# Altium project Karta Radiowa.PrjPcb (part 8 of 9)

## Sheet Zegar.SchDoc
size A3
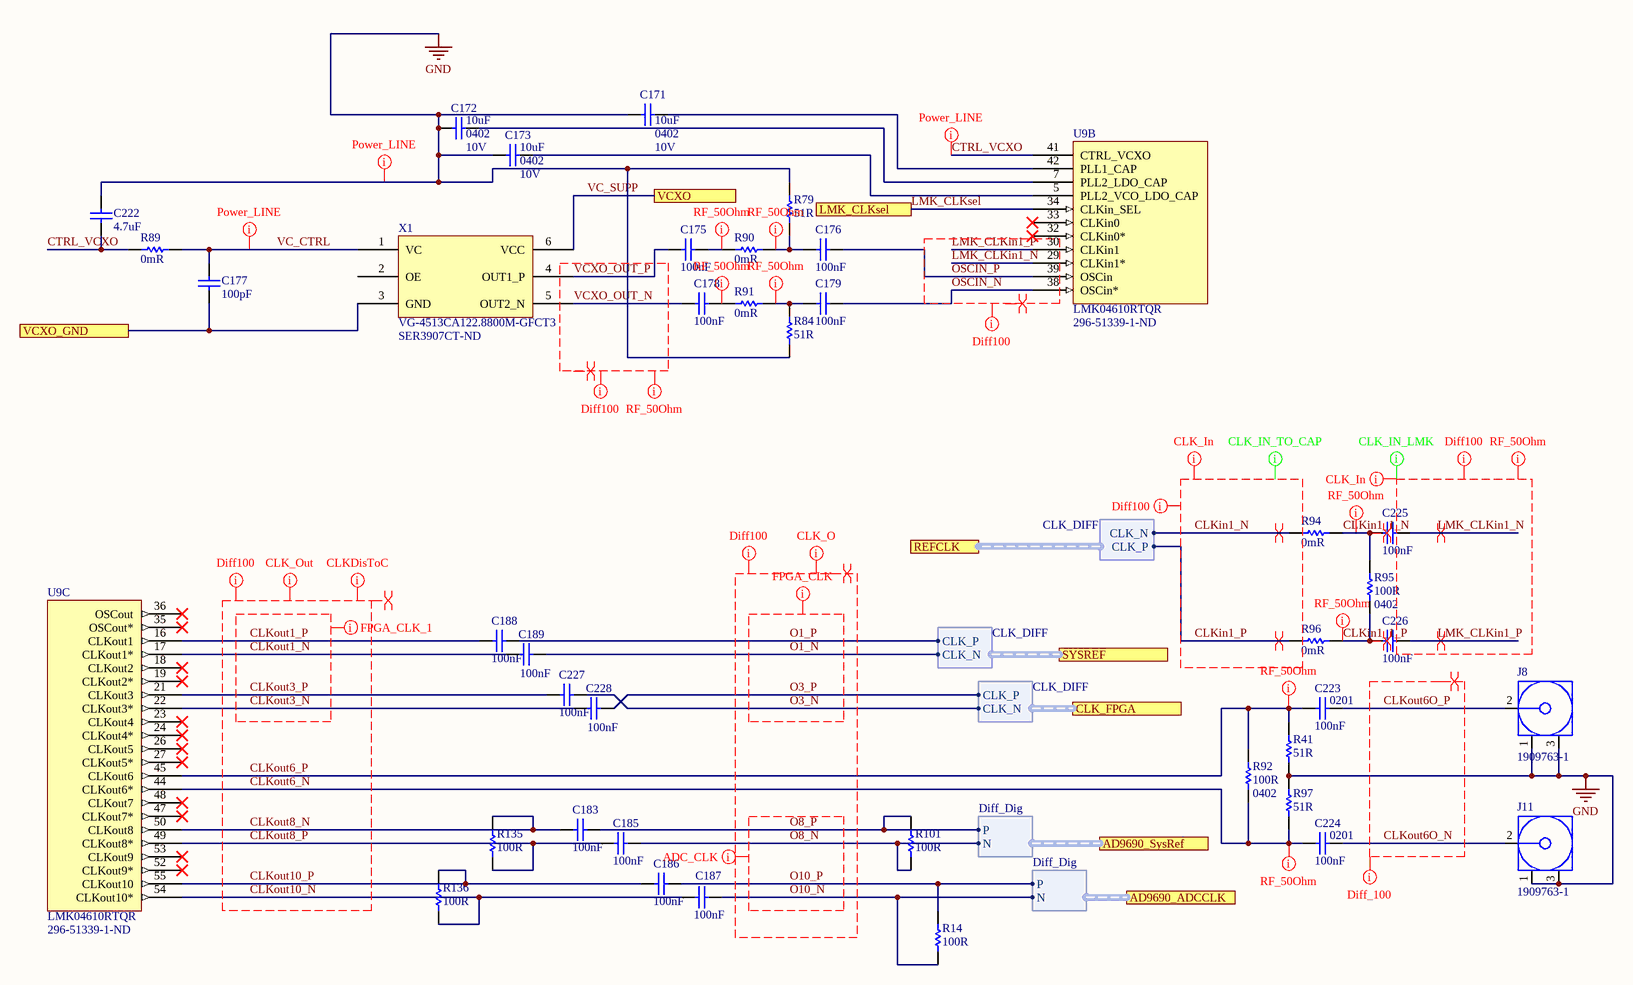
[diagram p11: Zegar.SchDoc]

### Parts
C171  10uF  Case/Package: 0402  Voltage Rating: 10V  [CAP 0402/1005 RF KK]
C172  10uF  Case/Package: 0402  Voltage Rating: 10V  [CAP 0402/1005 RF KK]
C173  10uF  Case/Package: 0402  Voltage Rating: 10V  [CAP 0402/1005 RF KK]
C175  100nF  [CAP 0201/0603 KK]
C176  100nF  [CAP 0201/0603 KK]
C177  100pF  [CAP 0402/1005 RF KK]
C178  100nF  [CAP 0201/0603 KK]
C179  100nF  [CAP 0201/0603 KK]
C183  100nF  [CAP 0201/0603 KK]
C185  100nF  [CAP 0201/0603 KK]
C186  100nF  [CAP 0201/0603 KK]
C187  100nF  [CAP 0201/0603 KK]
C188  100nF  [CAP 0201/0603 KK]
C189  100nF  [CAP 0201/0603 KK]
C222  4.7uF  [CAP 0603/1608 RF]
C223  100nF  Case Code (Imperial): 0201  [CAP 0201/0603 KK]
C224  100nF  Case Code (Imperial): 0201  [CAP 0201/0603 KK]
C225  100nF  [CAP 0201/0603 KK]
C226  100nF  [CAP 0201/0603 KK]
C227  100nF  [CAP 0201/0603 KK]
C228  100nF  [CAP 0201/0603 KK]
J8  1909763-1  [TECO-1909763-1_V]
J11  1909763-1  [TECO-1909763-1_V]
R14  100R  [RES 0201/0603]
R41  51R  [RES 0402/1005 RF KK]
R79  51R  [RES 0402/1005 RF KK]
R84  51R  [RES 0402/1005 RF KK]
R89  0mR  [RES 0402/1005 RF KK]
R90  0mR  [RES 0402/1005 RF KK]
R91  0mR  [RES 0402/1005 RF KK]
R92  100R  Case/Package: 0402  [RES 0402/1005 RF KK]
R94  0mR  [RES 0402/1005 RF KK]
R95  100R  Case/Package: 0402  [RES 0402/1005 RF KK]
R96  0mR  [RES 0402/1005 RF KK]
R97  51R  [RES 0402/1005 RF KK]
R101  100R  [RES 0201/0603]
R135  100R  [RES 0201/0603]
R136  100R  [RES 0201/0603]
U9  LMK04610RTQR  Supplier Part Number 1: 296-51339-1-ND  [LMK04610]  (parts B,C of 4)
X1  VG-4513CA122.8800M-GFCT3  Supplier Part Number 1: SER3907CT-ND  [VG-4513CA]

### Ports
AD9690_ADCCLK (harness Diff_Dig), AD9690_SysRef (harness Diff_Dig), CLK_FPGA (harness CLK_DIFF), LMK_CLKsel, REFCLK (harness CLK_DIFF), SYSREF (harness CLK_DIFF), VCXO, VCXO_GND

### Harnesses
Diff_Dig: P, N
CLK_DIFF: CLK_P, CLK_N

### Nets
GND: C171.2 C172.2 C173.2 C222.2 J8.1 J8.3 J11.1 J11.3 R41.1 R79.2 R84.1 R97.1
CLKin1_1_N: C225.1 R94.2 R95.1
CLKin1_1_P: C226.1 R95.2 R96.2
CLKin1_N: R94.1 ; port REFCLK.CLK_N
CLKin1_P: R96.1 ; port REFCLK.CLK_P
CLKout1_N: C189.1 U9.17(CLKout1*)
CLKout1_P: C188.1 U9.16(CLKout1)
CLKout3_N: C228.1 U9.22(CLKout3*)
CLKout3_P: C227.1 U9.21(CLKout3)
CLKout6_N: C224.1 R92.2 R97.2 U9.44(CLKout6*)
CLKout6_P: C223.1 R41.2 R92.1 U9.45(CLKout6)
CLKout6O_N: C224.2 J11.2
CLKout6O_P: C223.2 J8.2
CLKout8_N: C183.1 R135.2 U9.50(CLKout8)
CLKout8_P: C185.1 R135.1 U9.49(CLKout8*)
CLKout10_N: C187.1 R136.1 U9.54(CLKout10*)
CLKout10_P: C186.1 R136.2 U9.55(CLKout10)
CTRL_VCXO: C222.1 R89.1 U9.41(CTRL_VCXO)
GND_VCXO: C177.1 X1.3(GND) ; port VCXO_GND
LMK_CLKin1_N: C225.2 U9.29(CLKin1*)
LMK_CLKin1_P: C226.2 U9.30(CLKin1)
LMK_CLKsel: U9.34(CLKin_SEL) ; port LMK_CLKsel
O1_N: C189.2 ; port SYSREF.CLK_N
O1_P: C188.2 ; port SYSREF.CLK_P
O3_N: C227.2 ; port CLK_FPGA.CLK_N
O3_P: C228.2 ; port CLK_FPGA.CLK_P
O8_N: C185.2 R101.1 ; port AD9690_SysRef.N  [project net adc_Sysref_N]
O8_P: C183.2 R101.2 ; port AD9690_SysRef.P  [project net adc_Sysref_P]
O10_N: C187.2 R14.1 ; port AD9690_ADCCLK.N  [project net ADC_CLK9690_N]
O10_P: C186.2 R14.2 ; port AD9690_ADCCLK.P  [project net ADC_CLK9690_P]
OSCIN_N: C179.2 U9.38(OSCin*)
OSCIN_P: C176.2 U9.39(OSCin)
VC_CTRL: C177.2 R89.2 X1.1(VC)
VC_SUPP: X1.6(VCC) ; port VCXO
VCXO_OUT_N: C178.1 X1.5(OUT2_N)
VCXO_OUT_P: C175.1 X1.4(OUT1_P)
NetC171_1: C171.1 U9.42(PLL1_CAP)
NetC172_1: C172.1 U9.7(PLL2_LDO_CAP)
NetC173_1: C173.1 U9.5(PLL2_VCO_LDO_CAP)
NetC175_2: C175.2 R90.1
NetC176_1: C176.1 R79.1 R90.2
NetC178_2: C178.2 R91.1
NetC179_1: C179.1 R84.2 R91.2

Not connected (* = marked no-connect by the designer): U9 18(CLKout2)* 19(CLKout2*)* 23(CLKout4)* 24(CLKout4*)* 26(CLKout5)* 27(CLKout5*)* 32(CLKin0*)* 33(CLKin0)* 35(OSCout*)* 36(OSCout)* 47(CLKout7*)* 48(CLKout7)* 52(CLKout9*)* 53(CLKout9)*; X1 2(OE)

### Layout directives
net class CLK_IN1: CLKin1_N, CLKin1_P
net class CLK_IN2: LMK_CLKin1_N, LMK_CLKin1_P
net class CLK_O: O1_N, O1_P, O3_N, O3_P, O8_N, O8_P, O10_N, O10_P
net class ADC_CLK: O8_N, O8_P, O10_N, O10_P
net class Diff_100: CLKin1_N, CLKin1_P, CLKout1_N, CLKout1_P, CLKout3_N, CLKout3_P, CLKout6_N, CLKout6_P, CLKout6O_N, CLKout6O_P, CLKout8_N, CLKout8_P, CLKout10_N, CLKout10_P, LMK_CLKin1_N, LMK_CLKin1_P, O1_N, O1_P, O3_N, O3_P, O8_N, O8_P, O10_N, O10_P, OSCIN_N, OSCIN_P, VCXO_OUT_N, VCXO_OUT_P
net class CLK_Out: CLKout1_N, CLKout1_P, CLKout3_N, CLKout3_P, CLKout6_N, CLKout6_P, CLKout8_N, CLKout8_P, CLKout10_N, CLKout10_P
net class CLKDisToC: CLKout1_N, CLKout1_P, CLKout3_N, CLKout3_P, CLKout6_N, CLKout6_P, CLKout8_N, CLKout8_P, CLKout10_N, CLKout10_P
net class Power_LINE: CTRL_VCXO, GND, VC_CTRL
net class CLK_IN_TO_CAP: CLKin1_N, CLKin1_P
net class CLK_IN_LMK: LMK_CLKin1_N, LMK_CLKin1_P
differential pair; differential pair class Diff_100: CLKin1_1_N, CLKin1_1_P, CLKin1_N, CLKin1_P, CLKout1_N, CLKout1_P, CLKout3_N, CLKout3_P, CLKout6_N, CLKout6_P, CLKout6O_N, CLKout6O_P, CLKout8_N, CLKout8_P, CLKout10_N, CLKout10_P, LMK_CLKin1_N, LMK_CLKin1_P, O1_N, O1_P, O3_N, O3_P, O8_N, O8_P, O10_N, O10_P, OSCIN_N, OSCIN_P, VCXO_OUT_N, VCXO_OUT_P
net class FPGA_CLK: O1_N, O1_P, O3_N, O3_P
net class Single50: CLKin1_1_N, CLKin1_1_P, CLKout6_N, CLKout6_P, LMK_CLKin1_N, LMK_CLKin1_P, NetC175_2, NetC176_1, NetC178_2, NetC179_1, VCXO_OUT_N, VCXO_OUT_P
net class FPGA_CLK_1: CLKout1_N, CLKout1_P, CLKout3_N, CLKout3_P

### Notes on the sheet
- Title
- Size:
- Date:
- A3
- Number:
- Time:
- Revision:
- Sheet
- of
- File:

### Library data of the parts
C171-C173 = Capacitor: CAP CER 10UF 10V X5R 0402; Manufacturer: Samsung; Manufacturer Part Number: CL05A106MP8NUB8; Tolerance: 20%; Supplier 1: Digi-Key; Supplier Part Number 1: 1276-6830-1-ND; RoHS: Yes; Category: Ceramic Capacitors; Stock 1: 1457006; Pricing 1: 1=0,40000, 10=0,27900, 50=0,19500, 100=0,16710, 500=0,12534, 1000=0,10584, 2500=0,10027 (USD); Mount: Surface Mount; Case Code (Metric): 1005; Case Code (Imperial): 0402; Min Operating Temperature: -55°C; Max Operating Temperature: 85°C; Packaging: Tape and Reel; Capacitance: 10uF; Length: 0.039inch; Width: 0.02inch; Thickness: 0.035inch; ComponentLink1URL: http://www.samsungsem.com/kr/support/product-search/mlcc/CL05A106MP8NUB8.jsp?src-supplier=Digi-Key; ComponentLink1Description: http://www.samsungsem.com/kr/support/product-search/mlcc/CL05A106MP8NUB8.jsp?src-supplier=Digi-Key
C175 C176 C178 C179 C183 C185-C189 C223-C228 = Capacitor: Manufacturer 1: Yageo; Manufacturer Part Number 1: CC0201KRX5R6BB104; Voltage Rating (DC): 10V; Tolerance: 10%; Dielectric: X5R; Supplier 1: Digi-Key; Supplier Part Number 1: 311-1593-1-ND; Stock 1: 1229391; Pricing 1: 1=0.10000, 10=0.03800, 100=0.01690, 500=0.01208, 1000=0.00949, 2500=0.00862, 5000=0.00794 (USD); RoHS: Yes; Mount: Surface Mount; Case/Package: 0201; Weight: 6E-06oz; Case Code (Metric): 0603; Min Operating Temperature: -55°C; Max Operating Temperature: 85°C; Capacitance: 100nF; Packaging: Tape and Reel; Termination: SMD/SMT; Composition: Ceramic; Voltage Rating: 10V; Length: 0.6mm; Height: 0.3mm; Width: 0.012inch; Thickness: 0.013inch; Depth: 0.3mm; Radiation Hardening: No; Lead Free: Lead Free; Halogen Free: Halogen Free; ComponentLink1URL: https://datasheet.ciiva.com/17437/upy-gphc-x5r-4v-to-50v-12-17437495.pdf?src-supplier=Avnet+Europe; ComponentLink1Description: https://datasheet.ciiva.com/17437/upy-gphc-x5r-4v-to-50v-12-17437495.pdf?src-supplier=Avnet+Europe; ComponentLink2URL: https://datasheet.ciiva.com/11587/upy-gphc-x5r-4v-to-50v-12-11587190.pdf?src-supplier=Avnet; ComponentLink2Description: https://datasheet.ciiva.com/11587/upy-gphc-x5r-4v-to-50v-12-11587190.pdf?src-supplier=Avnet
  C175 C176 C178 C179 C183 C185-C189 C225-C228: Case Code (Imperial): 0201
C177 = Capacitor: Manufacturer 1: KEMET; Manufacturer Part Number 1: C0402C101J5GACAUTO; Dielectric Material: Ceramic; Tolerance: 5%; Voltage Rating: 50V; Dielectric: C0G; Supplier 1: Digi-Key; Supplier Part Number 1: 399-6823-1-ND; Stock 1: 66452; Pricing 1: 1=0.11000, 10=0.08400, 100=0.03730, 500=0.02664, 1000=0.02093, 2500=0.01903, 5000=0.01751 (USD); RoHS: Yes; Mount: Surface Mount; Case/Package: 0402; Case Code (Metric): 1005; Case Code (Imperial): 0402; Min Operating Temperature: -55°C; Max Operating Temperature: 125°C; Package Quantity: 10000; Capacitance: 100pF; Packaging: Tape and Reel; Voltage Rating (DC): 50V; Length: 1mm; Width: 0.02inch; Thickness: 0.022inch; Depth: 0.5mm; Ratings: AEC-Q200; Radiation Hardening: No; REACH SVHC: No SVHC; Lead Free: Lead Free; ComponentLink1URL: https://datasheet.ciiva.com/26923/getdatasheetpartid-385375-26923866.pdf?src-supplier=Verical; ComponentLink1Description: https://datasheet.ciiva.com/26923/getdatasheetpartid-385375-26923866.pdf?src-supplier=Verical
C222 = Capacitor: Manufacturer 1: Samsung; Manufacturer Part Number 1: CL10A475KQ8NNNC; Material: Ceramic; Tolerance: 20%; Voltage Rating: 6.3V; Dielectric: X5R; Supplier 1: Digi-Key; Supplier Part Number 1: 1276-1045-1-ND; Stock 1: 3419762; Pricing 1: 1=0.10000, 10=0.05500, 100=0.02450, 500=0.01750, 1000=0.01375 (USD); RoHS: Yes; Mount: Surface Mount; Case/Package: 0603; Case Code (Metric): 1608; Case Code (Imperial): 0603; Contact Plating: Tin; Min Operating Temperature: -55°C; Max Operating Temperature: 85°C; Capacitance: 4.7uF; Packaging: Tape and Reel; Package Quantity: 1; Voltage: 6.3V; Length: 1.6mm; Height: 0.8mm; Width: 0.031inch; Thickness: 0.035inch; Depth: 0.8mm; Radiation Hardening: No; ComponentLink1URL: https://datasheet.ciiva.com/15195/getdatasheetpartid-358620-15195714.pdf?src-supplier=Verical; ComponentLink1Description: https://datasheet.ciiva.com/15195/getdatasheetpartid-358620-15195714.pdf?src-supplier=Verical; ComponentLink2URL: https://datasheet.ciiva.com/29198/457675-da-01-en-vs-kondensator-0603-29198672.pdf?src-supplier=Conrad; ComponentLink2Description: https://datasheet.ciiva.com/29198/457675-da-01-en-vs-kondensator-0603-29198672.pdf?src-supplier=Conrad; ComponentLink3URL: https://datasheet.ciiva.com/16437/cl05b104kq5nnnc-16437321.pdf?src-supplier=Future+Electronics; ComponentLink3Description: https://datasheet.ciiva.com/16437/cl05b104kq5nnnc-16437321.pdf?src-supplier=Future+Electronics
J8 J11 = 1909763-1: Ultra Miniature Coaxial Connector Jack, 60 V, 50 Ohm, -40 to 90 degC, RoHS, Tape and Reel; Brand: TE Connectivity / AMP; Maximum Frequency: 6 GHz; Gender: Jack (Female); Body Material: Liquid Crystal Polymer (LCP); RF Series: UMCC; Impedance: 50 Ohms; DatasheetVersion: Rev. B2; PackageReference: SMD; PackageDescription: 3-Pin Surface Mount Device, Body 2.6 x 2.6 mm; Supplier 1: Newark; Supplier Part Number 1: 62X0488; Supplier 2: Farnell; Supplier Part Number 2: 2781689; Supplier 3: Digi-Key; Supplier Part Number 3: A118077TR-ND; Supplier 4: Digi-Key; Supplier Part Number 4: A118077CT-ND; Supplier 5: Digi-Key; Supplier Part Number 5: A118077DKR-ND; Product Category: RF Connectors / Coaxial Connectors; Packaging: Reel; Product: Connectors; Orientation: Straight; Operating Temperature Range: - 40 C to + 90 C; Factory Pack Quantity: 5000; RoHS: Details; Contact Plating: Gold; Contact Material: Copper Alloy; Mounting Technology: Surface Mount; ComponentLink1Description: Manufacturer URL; ComponentLink1URL: http://www.te.com; ComponentLink2Description: Datasheet; ComponentLink2URL: http://www.te.com/commerce/DocumentDelivery/DDEController?Action=srchrtrv&DocNm=1909763&DocType=Customer+Drawing&DocLang=English
R14 R101 R135 R136 = Resistor: Manufacturer 1: Panasonic; Manufacturer Part Number 1: ERJ-1GEF1000C; Tolerance: 1%; Power Rating: 50mW; Voltage Rating: 25V; Temperature Coefficient: 200ppm/°C; Voltage Rating (DC): 15V; Supplier 1: Mouser; Supplier Part Number 1: 667-ERJ-1GEF1000C; Stock 1: 517; Pricing 1: 1=0.10000, 10=0.03100, 100=0.01400, 1000=0.01000, 5000=0.00700, 10000=0.00600 (USD); RoHS: Yes; Mount: Surface Mount; Case/Package: 0201; Case Code (Metric): 0603; Case Code (Imperial): 0201; Contact Plating: Tin; Min Operating Temperature: -55°C; Max Operating Temperature: 125°C; Resistance: 100R; Packaging: Tape and Reel; Package Quantity: 15000; Composition: Thick Film; Number of Terminations: 2; Termination: SMD/SMT; Military Standard: Not; Max Power Dissipation: 50mW; Length: 0.6mm; Height: 0.23mm; Width: 0.012inch; Depth: 0.3mm; REACH SVHC: Unknown; Lead Free: Lead Free; ComponentLink1URL: https://datasheet.ciiva.com/16427/erj-1gef1000c-16427637.pdf?src-supplier=Future+Electronics; ComponentLink1Description: https://datasheet.ciiva.com/16427/erj-1gef1000c-16427637.pdf?src-supplier=Future+Electronics; ComponentLink2URL: https://datasheet.ciiva.com/16766/70260683-16766261.pdf?src-supplier=Allied+Electronics; ComponentLink2Description: https://datasheet.ciiva.com/16766/70260683-16766261.pdf?src-supplier=Allied+Electronics; ComponentLink3URL: https://datasheet.ciiva.com/16776/70260683-16776517.pdf?src-supplier=Allied+Electronics; ComponentLink3Description: https://datasheet.ciiva.com/16776/70260683-16776517.pdf?src-supplier=Allied+Electronics; ComponentLink4URL: https://datasheet.ciiva.com/7830/1678796-7830951.pdf?src-supplier=Element14; ComponentLink4Description: https://datasheet.ciiva.com/7830/1678796-7830951.pdf?src-supplier=Element14
R41 R79 R84 R97 = Resistor: Manufacturer 1: Susumu; Manufacturer Part Number 1: RR0510R-510-D; Tolerance: 0.5%; Power Rating: 63mW; Voltage Rating: 25V; Temperature Coefficient: 100ppm/°C; Supplier 1: Digi-Key; Supplier Part Number 1: RR05R51DCT-ND; Stock 1: 85168; Pricing 1: 1=0.10000, 10=0.07400, 100=0.02850, 1000=0.01254, 2500=0.01083, 5000=0.00969 (USD); RoHS: Yes; Case/Package: 0402; Number of Pins: 2; Case Code (Metric): 1005; Case Code (Imperial): 0402; Min Operating Temperature: -55°C; Max Operating Temperature: 125°C; Resistance: 51R; Package Quantity: 1; Packaging: Tape and Reel; Composition: Thin Film; Number of Terminations: 2; Termination: SMD/SMT; Max Power Dissipation: 63mW; Voltage Rating (DC): 25V; Length: 0.039inch; Height: 0.016inch; Width: 0.02inch; REACH SVHC: Unknown; Lead Free: Lead Free; ComponentLink1URL: https://datasheet.ciiva.com/2486/rr-data-sheet-2486920.pdf?src-supplier=Digi-Key; ComponentLink1Description: https://datasheet.ciiva.com/2486/rr-data-sheet-2486920.pdf?src-supplier=Digi-Key; ComponentLink2URL: https://datasheet.ciiva.com/2486/rr-data-sheet-2486921.pdf?src-supplier=Digi-Key; ComponentLink2Description: https://datasheet.ciiva.com/2486/rr-data-sheet-2486921.pdf?src-supplier=Digi-Key; ComponentLink3URL: https://datasheet.ciiva.com/2486/rr-data-sheet-2486922.pdf?src-supplier=Digi-Key; ComponentLink3Description: https://datasheet.ciiva.com/2486/rr-data-sheet-2486922.pdf?src-supplier=Digi-Key; ComponentLink4URL: https://datasheet.ciiva.com/28635/87330-28635919.pdf?src-supplier=Element14; ComponentLink4Description: https://datasheet.ciiva.com/28635/87330-28635919.pdf?src-supplier=Element14
R89-R91 R94 R96 = Resistor: Manufacturer 1: Yageo; Manufacturer Part Number 1: RC0402JR-070RL; Power Rating: 62.5mW; Tolerance: 5%; Voltage Rating: 50V; Max Power Dissipation: 63mW; Temperature Coefficient: 200ppm/°C; Supplier 1: Digi-Key; Supplier Part Number 1: 311-0.0JRCT-ND; Stock 1: 69822252; Pricing 1: 1=0.10000, 10=0.01200, 25=0.00920, 50=0.00680, 100=0.00510, 250=0.00388, 500=0.00308, 1000=0.00227, 5000=0.00163 (USD); RoHS: Yes; Case/Package: 0402; Contact Plating: Tin,Matte; Case Code (Metric): 1005; Case Code (Imperial): 0402; Min Operating Temperature: -55°C; Max Operating Temperature: 155°C; Resistance: 0mR; Packaging: Tape and Reel; Composition: Thick Film; Package Quantity: 1; Number of Terminations: 2; Termination: SMD/SMT; Military Standard: Not; Features: Moisture Resistant; Length: 1mm; Height: 0.016inch; Width: 0.02inch; Depth: 0.5mm; Radiation Hardening: No; REACH SVHC: Unknown; Lead Free: Lead Free; ComponentLink1URL: https://datasheet.ciiva.com/2452/pyu-rc0402-51-rohs-l-6-2452608.pdf?src-supplier=Digi-Key; ComponentLink1Description: https://datasheet.ciiva.com/2452/pyu-rc0402-51-rohs-l-6-2452608.pdf?src-supplier=Digi-Key; ComponentLink2URL: https://datasheet.ciiva.com/11808/0900766b80c66297-11808195.pdf?src-supplier=RSComponents; ComponentLink2Description: https://datasheet.ciiva.com/11808/0900766b80c66297-11808195.pdf?src-supplier=RSComponents; ComponentLink3URL: https://datasheet.ciiva.com/2452/pyu-r-int-thick-7-2452609.pdf?src-supplier=Digi-Key; ComponentLink3Description: https://datasheet.ciiva.com/2452/pyu-r-int-thick-7-2452609.pdf?src-supplier=Digi-Key; ComponentLink4URL: https://datasheet.ciiva.com/22747/1018594-22747515.pdf?src-supplier=Element14; ComponentLink4Description: https://datasheet.ciiva.com/22747/1018594-22747515.pdf?src-supplier=Element14; ComponentLink5URL: https://datasheet.ciiva.com/7983/1018594-7983535.pdf?src-supplier=Element14; ComponentLink5Description: https://datasheet.ciiva.com/7983/1018594-7983535.pdf?src-supplier=Element14; ComponentLink6URL: https://datasheet.ciiva.com/2452/pyu-r-int-thick-7-2452610.pdf?src-supplier=Digi-Key; ComponentLink6Description: https://datasheet.ciiva.com/2452/pyu-r-int-thick-7-2452610.pdf?src-supplier=Digi-Key; ComponentLink7URL: https://datasheet.ciiva.com/8896/pyu-rc0402-51-rohs-l-6-8896201.pdf?src-supplier=Avnet; ComponentLink7Description: https://datasheet.ciiva.com/8896/pyu-rc0402-51-rohs-l-6-8896201.pdf?src-supplier=Avnet; ComponentLink8URL: https://datasheet.ciiva.com/28386/pyu-rc0402-51-rohs-l-6-28386633.pdf?src-supplier=Avnet+Europe; ComponentLink8Description: https://datasheet.ciiva.com/28386/pyu-rc0402-51-rohs-l-6-28386633.pdf?src-supplier=Avnet+Europe; ComponentLink9URL: https://datasheet.ciiva.com/15189/getdatasheetpartid-326379-15189533.pdf?src-supplier=Verical; ComponentLink9Description: https://datasheet.ciiva.com/15189/getdatasheetpartid-326379-15189533.pdf?src-supplier=Verical
R92 R95 = Resistor: YAGEO - RC0402FR-07100RL. - RES, THICK FILM, 100R, 1%, 0.0625W, 0402, REEL; Temperature Coefficient: 100ppm/°C; Power Rating: 62.5mW; Voltage Rating: 50V; Supplier 1: Digi-Key; Supplier Part Number 1: 311-100LRCT-ND; Manufacturer: Yageo; Manufacturer Part Number: RC0402FR-07100RL; RoHS: Yes; Category: Chip SMD Resistors; Stock 1: 31356128; Pricing 1: 1=0,10000, 10=0,01600, 100=0,00640, 1000=0,00289, 2500=0,00251, 5000=0,00207 (USD); Number of Pins: 2; Case Code (Imperial): 0402; Case Code (Metric): 1005; Min Operating Temperature: -55°C; Max Operating Temperature: 155°C; Military Standard: Not; Tolerance: 1%; Resistance: 100R; Packaging: Tape and Reel; Termination: SMD/SMT; Composition: Thick Film; Voltage Rating (DC): 50V; Length: 1mm; Height: 0.32mm; Depth: 0.5mm; Width: 0.5mm; Lead Free: Lead Free; REACH SVHC: No SVHC; ComponentLink1URL: https://datasheet.ciiva.com/7849/1784430-7849810.pdf?src-supplier=Element14; ComponentLink1Description: https://datasheet.ciiva.com/7849/1784430-7849810.pdf?src-supplier=Element14; ComponentLink2URL: https://datasheet.ciiva.com/11808/0900766b80c66297-11808765.pdf?src-supplier=RSComponents; ComponentLink2Description: https://datasheet.ciiva.com/11808/0900766b80c66297-11808765.pdf?src-supplier=RSComponents; ComponentLink3URL: https://datasheet.ciiva.com/16740/pyu-rc0402-51-rohs-l-6-r-16740566.pdf?src-supplier=Future+Electronics; ComponentLink3Description: https://datasheet.ciiva.com/16740/pyu-rc0402-51-rohs-l-6-r-16740566.pdf?src-supplier=Future+Electronics; ComponentLink4URL: https://datasheet.ciiva.com/15189/getdatasheetpartid-329466-15189335.pdf?src-supplier=Verical; ComponentLink4Description: https://datasheet.ciiva.com/15189/getdatasheetpartid-329466-15189335.pdf?src-supplier=Verical; ComponentLink5URL: https://datasheet.ciiva.com/28367/1018594-28367226.pdf?src-supplier=Element14; ComponentLink5Description: https://datasheet.ciiva.com/28367/1018594-28367226.pdf?src-supplier=Element14; ComponentLink6URL: https://datasheet.ciiva.com/12667/pyu-rc0402-51-rohs-l-6-r-12667957.pdf?src-supplier=Mouser; ComponentLink6Description: https://datasheet.ciiva.com/12667/pyu-rc0402-51-rohs-l-6-r-12667957.pdf?src-supplier=Mouser; ComponentLink7URL: https://datasheet.ciiva.com/22747/1018594-22747511.pdf?src-supplier=Element14; ComponentLink7Description: https://datasheet.ciiva.com/22747/1018594-22747511.pdf?src-supplier=Element14
U9 = LMK04610RTQR: Manufacturer: Texas Instruments; Number of Inputs: 2; Number of Outputs: 10; Supplier 1: Digi-Key; Manufacturer Part Number: LMK04610RTQR; Stock 1: 2022; Pricing 1: 1 = 20,47000, 10 = 18,87700, 100 = 16,11940, 500 = 14,63474 (USD); RoHS: No; Min Operating Temperature: -40°C; Max Operating Temperature: 85°C
X1 = VG-4513CA122.8800M-GFCT3: OSC VCXO 122.88MHZ LVPECL SMD; Manufacturer: Epson; Max Supply Current: 65mA; Supplier 1: Digi-Key; Manufacturer Part Number: VG-4513CA122.8800M-GFCT3; Stock 1: 438; Pricing 1: 1 = 9,91000, 10 = 9,29000, 50 = 8,97980, 100 = 8,67020 (USD); RoHS: Yes; Mount: Surface Mount; Case/Package: SMD/SMT; Min Operating Temperature: -40°C; Max Operating Temperature: 85°C; Packaging: Tape and Reel; Frequency: 122.88MHz; Length: 0.276inch; Height: 0.071inch; Width: 0.197inch; Lead Free: Lead Free; ComponentLink1URL: https://datasheet.ciiva.com/29626/vg-4513ca-partnumber-29626986.pdf?src-supplier=Digi-Key; ComponentLink1Description: https://datasheet.ciiva.com/29626/vg-4513ca-partnumber-29626986.pdf?src-supplier=Digi-Key; ComponentLink2URL: https://datasheet.ciiva.com/29626/vg-4513ca-partnumber-29626987.pdf?src-supplier=Digi-Key; ComponentLink2Description: https://datasheet.ciiva.com/29626/vg-4513ca-partnumber-29626987.pdf?src-supplier=Digi-Key; ComponentLink3URL: https://datasheet.ciiva.com/29626/076-vg-4513ca-cb-e13ya-29626988.pdf?src-supplier=Digi-Key; ComponentLink3Description: https://datasheet.ciiva.com/29626/076-vg-4513ca-cb-e13ya-29626988.pdf?src-supplier=Digi-Key

## Sheet Current_and_voltage.SchDoc
size A3
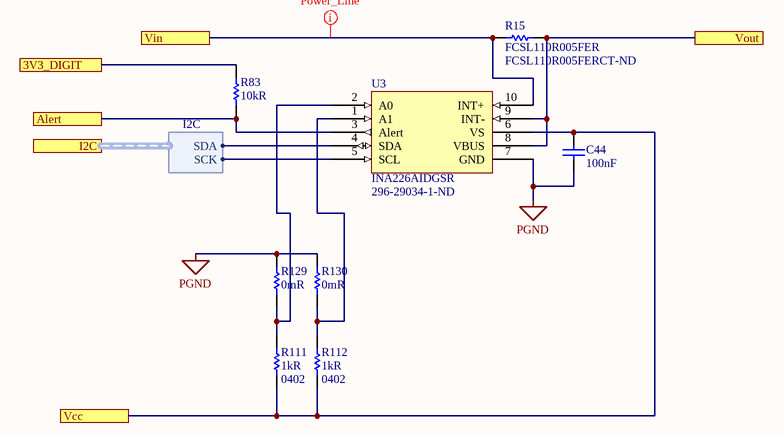
[diagram p12: Current_and_voltage.SchDoc]

### Parts
C44  100nF  [CAP 0201/0603 KK]
R15  FCSL110R005FER  [FCSL110R005FERCT-ND]
R83  10kR  [RES 0402/1005 RF KK]
R111  1kR  Case/Package: 0402  [RES 0402/1005 RF KK]
R112  1kR  Case/Package: 0402  [RES 0402/1005 RF KK]
R129  0mR  [RES 0402/1005 RF KK]
R130  0mR  [RES 0402/1005 RF KK]
U3  INA226AIDGSR  Supplier Part Number 1: 296-29034-1-ND  [INA226]

### Ports
3V3_DIGIT, Alert, I2C (harness I2C), Vcc, Vin, Vout

### Harnesses
I2C: SCK, SDA

### Nets
3V3_MB: C44.2 R111.1 R112.1 U3.6(VS) ; port Vcc
+12: R15.1 U3.10(INT+) ; port Vin
PGND: C44.1 R129.2 R130.2 U3.7(GND)
3V3@0A5_COM: R83.2 ; port 3V3_DIGIT
12V: R15.2 U3.8(VBUS) U3.9(INT-) ; port Vout
Alert: R83.1 U3.3(Alert) ; port Alert
I2C_SCL: U3.5(SCL) ; port I2C.SCK
I2C_SDA: U3.4(SDA) ; port I2C.SDA
NetR111_2: R111.2 R129.1 U3.2(A0)
NetR112_2: R112.2 R130.1 U3.1(A1)

### Layout directives
net class Power_LINE: +12

### Notes on the sheet
- Title
- Size:
- Date:
- A3
- Number:
- Time:
- Revision:
- Sheet
- of
- File:

### Library data of the parts
C44 = Capacitor: as C175 on sheet Zegar; Supplier 1: Digi-Key; Supplier Part Number 1: 311-1593-1-ND; Stock 1: 1229391; Pricing 1: 1=0.10000, 10=0.03800, 100=0.01690, 500=0.01208, 1000=0.00949, 2500=0.00862, 5000=0.00794 (USD); RoHS: Yes; Mount: Surface Mount; Case/Package: 0201; Weight: 6E-06oz; Case Code (Imperial): 0201; Case Code (Metric): 0603; Min Operating Temperature: -55°C; Max Operating Temperature: 85°C; Capacitance: 100nF; Packaging: Tape and Reel; Termination: SMD/SMT; Composition: Ceramic; Voltage Rating: 10V; Length: 0.6mm; Height: 0.3mm; Width: 0.012inch; Thickness: 0.013inch; Depth: 0.3mm; Radiation Hardening: No; Lead Free: Lead Free; Halogen Free: Halogen Free; ComponentLink1URL: https://datasheet.ciiva.com/17437/upy-gphc-x5r-4v-to-50v-12-17437495.pdf?src-supplier=Avnet+Europe; ComponentLink1Description: https://datasheet.ciiva.com/17437/upy-gphc-x5r-4v-to-50v-12-17437495.pdf?src-supplier=Avnet+Europe; ComponentLink2URL: https://datasheet.ciiva.com/11587/upy-gphc-x5r-4v-to-50v-12-11587190.pdf?src-supplier=Avnet; ComponentLink2Description: https://datasheet.ciiva.com/11587/upy-gphc-x5r-4v-to-50v-12-11587190.pdf?src-supplier=Avnet
R15 = FCSL110R005FER: RES SMD 5 MOHM 5W 4320 WIDE; Manufacturer: Ohmite; Tolerance: 1%; Resistance: 5mR; Temperature Coefficient: 50ppm/°C; Supplier 1: Digi-Key; Manufacturer Part Number: FCSL110R005FER; Stock 1: 3877; Pricing 1: 1 = 2,79000, 10 = 2,47700, 25 = 2,29720, 50 = 2,16220, 100 = 1,89190, 250 = 1,62164, 500 = 1,35136 (USD); RoHS: Yes; Case/Package: Metal; Number of Pins: 2; Min Operating Temperature: -55°C; Max Operating Temperature: 155°C; Packaging: Tape and Reel; Package Quantity: 1; Max Power Dissipation: 5W; Features: Moisture Resistant; Power Rating: 5W; Termination: SMD/SMT; Composition: Metal Foil; Number of Terminations: 2; Length: 0.197inch; Height: 0.028inch; Width: 11mm; Depth: 5mm; REACH SVHC: Unknown; ComponentLink1URL: https://datasheet.ciiva.com/2484/res-fcsl-2484643.pdf?src-supplier=Digi-Key; ComponentLink1Description: https://datasheet.ciiva.com/2484/res-fcsl-2484643.pdf?src-supplier=Digi-Key; ComponentLink2URL: https://datasheet.ciiva.com/2484/res-fcsl-2484644.pdf?src-supplier=Digi-Key; ComponentLink2Description: https://datasheet.ciiva.com/2484/res-fcsl-2484644.pdf?src-supplier=Digi-Key; ComponentLink3URL: https://datasheet.ciiva.com/2484/res-fcsl-2484645.pdf?src-supplier=Digi-Key; ComponentLink3Description: https://datasheet.ciiva.com/2484/res-fcsl-2484645.pdf?src-supplier=Digi-Key; ComponentLink4URL: https://datasheet.ciiva.com/6181/fcsl-6181333.pdf?src-supplier=Farnell; ComponentLink4Description: https://datasheet.ciiva.com/6181/fcsl-6181333.pdf?src-supplier=Farnell; ComponentLink5URL: https://datasheet.ciiva.com/46422/1812595-46422917.pdf?src-supplier=Element14; ComponentLink5Description: https://datasheet.ciiva.com/46422/1812595-46422917.pdf?src-supplier=Element14; ComponentLink6URL: https://datasheet.ciiva.com/8080/fcsl-8080343.pdf?src-supplier=Element14; ComponentLink6Description: https://datasheet.ciiva.com/8080/fcsl-8080343.pdf?src-supplier=Element14; Supplier Part Number 1: FCSL110R005FERCT-ND
R83 = Resistor: Manufacturer 1: Vishay; Manufacturer Part Number 1: CRCW0402-10K0FKED; Tolerance: 1%; Power Rating: 63mW; Voltage Rating: 50V; Temperature Coefficient: 100ppm/°C; Supplier 1: Newark; Supplier Part Number 1: 52K6595; Stock 1: 0; RoHS: Yes; Mount: Surface Mount; Case/Package: 0402; Number of Pins: 2; Weight: 2.3E-05oz; Case Code (Metric): 1005; Case Code (Imperial): 0402; Contact Plating: Tin; Min Operating Temperature: -55°C; Max Operating Temperature: 155°C; Resistance: 10kR; Package Quantity: 10; Packaging: Tape and Reel; Termination: SMD/SMT; Military Standard: Not; Composition: Thick Film; Voltage Rating (DC): 50V; Number of Terminations: 2; Max Power Dissipation: 63mW; Features: Automotive AEC-Q200; Length: 1mm; Height: 0.35mm; Depth: 0.5mm; Width: 0.02inch; Radiation Hardening: No; REACH SVHC: Unknown; Lead Free: Lead Free; ComponentLink1URL: https://datasheet.ciiva.com/11809/0900766b80d98824-11809984.pdf?src-supplier=RSComponents; ComponentLink1Description: https://datasheet.ciiva.com/11809/0900766b80d98824-11809984.pdf?src-supplier=RSComponents; ComponentLink2URL: https://datasheet.ciiva.com/2463/dcrcwe3-2463025.pdf?src-supplier=Digi-Key; ComponentLink2Description: https://datasheet.ciiva.com/2463/dcrcwe3-2463025.pdf?src-supplier=Digi-Key; ComponentLink3URL: https://datasheet.ciiva.com/2463/dcrcwe3-2463026.pdf?src-supplier=Digi-Key; ComponentLink3Description: https://datasheet.ciiva.com/2463/dcrcwe3-2463026.pdf?src-supplier=Digi-Key; ComponentLink4URL: https://datasheet.ciiva.com/2463/dcrcwe3-2463027.pdf?src-supplier=Digi-Key; ComponentLink4Description: https://datasheet.ciiva.com/2463/dcrcwe3-2463027.pdf?src-supplier=Digi-Key; ComponentLink5URL: https://datasheet.ciiva.com/46385/1697337-46385560.pdf?src-supplier=Element14; ComponentLink5Description: https://datasheet.ciiva.com/46385/1697337-46385560.pdf?src-supplier=Element14; ComponentLink6URL: https://datasheet.ciiva.com/3255/dcrcwe3-3255961.pdf?src-supplier=Avnet; ComponentLink6Description: https://datasheet.ciiva.com/3255/dcrcwe3-3255961.pdf?src-supplier=Avnet; ComponentLink7URL: https://datasheet.ciiva.com/3255/dcrcwe3-3255962.pdf?src-supplier=Avnet; ComponentLink7Description: https://datasheet.ciiva.com/3255/dcrcwe3-3255962.pdf?src-supplier=Avnet; ComponentLink8URL: https://datasheet.ciiva.com/5547/dcrcwe3-109170-5547786.pdf?src-supplier=Mouser; ComponentLink8Description: https://datasheet.ciiva.com/5547/dcrcwe3-109170-5547786.pdf?src-supplier=Mouser; ComponentLink9URL: https://datasheet.ciiva.com/26316/fld-crcw-e3-data-en-26316618.pdf?src-supplier=Distrelec; ComponentLink9Description: https://datasheet.ciiva.com/26316/fld-crcw-e3-data-en-26316618.pdf?src-supplier=Distrelec; ComponentLink10URL: https://datasheet.ciiva.com/16208/dcrcwe3-16208525.pdf?src-supplier=Future+Electronics; ComponentLink10Description: https://datasheet.ciiva.com/16208/dcrcwe3-16208525.pdf?src-supplier=Future+Electronics; ComponentLink11URL: https://datasheet.ciiva.com/36856/1720486-36856909.pdf?src-supplier=Element14; ComponentLink11Description: https://datasheet.ciiva.com/36856/1720486-36856909.pdf?src-supplier=Element14
R111 R112 = Resistor: Manufacturer 1: Yageo; Manufacturer Part Number 1: RC0402FR-071KL; Tolerance: 1%; Temperature Coefficient: 100ppm/°C; Power Rating: 62.5mW; Voltage Rating: 50V; Supplier 1: Digi-Key; Supplier Part Number 1: 311-1.00KLRCT-ND; Stock 1: 57541929; Pricing 1: 1=0,10000, 10=0,01600, 100=0,00640, 1000=0,00289, 2500=0,00251, 5000=0,00207 (USD); RoHS: Yes; Number of Pins: 2; Case Code (Imperial): 0402; Case Code (Metric): 1005; Min Operating Temperature: -55°C; Max Operating Temperature: 155°C; Packaging: Tape and Reel; Resistance: 1kR; Composition: Thick Film; Voltage Rating (DC): 50V; Termination: SMD/SMT; Military Standard: Not; Length: 1mm; Height: 0.32mm; Width: 0.5mm; Depth: 0.5mm; REACH SVHC: Unknown; Lead Free: Lead Free; ComponentLink1URL: https://datasheet.ciiva.com/11819/0900766b80c66297-11819477.pdf?src-supplier=RSComponents; ComponentLink1Description: https://datasheet.ciiva.com/11819/0900766b80c66297-11819477.pdf?src-supplier=RSComponents; ComponentLink2URL: https://datasheet.ciiva.com/12666/pyu-rc0402-51-rohs-l-6-r-12666741.pdf?src-supplier=Mouser; ComponentLink2Description: https://datasheet.ciiva.com/12666/pyu-rc0402-51-rohs-l-6-r-12666741.pdf?src-supplier=Mouser; ComponentLink3URL: https://datasheet.ciiva.com/17063/pyu-rc0402-51-rohs-l-6-r-17063193.pdf?src-supplier=Future+Electronics; ComponentLink3Description: https://datasheet.ciiva.com/17063/pyu-rc0402-51-rohs-l-6-r-17063193.pdf?src-supplier=Future+Electronics; ComponentLink4URL: https://datasheet.ciiva.com/22747/1018594-22747513.pdf?src-supplier=Element14; ComponentLink4Description: https://datasheet.ciiva.com/22747/1018594-22747513.pdf?src-supplier=Element14; ComponentLink5URL: https://datasheet.ciiva.com/7849/1018594-7849869.pdf?src-supplier=Element14; ComponentLink5Description: https://datasheet.ciiva.com/7849/1018594-7849869.pdf?src-supplier=Element14; ComponentLink6URL: https://datasheet.ciiva.com/7983/1018594-7983502.pdf?src-supplier=Element14; ComponentLink6Description: https://datasheet.ciiva.com/7983/1018594-7983502.pdf?src-supplier=Element14; ComponentLink7URL: https://datasheet.ciiva.com/7849/1018594-7849871.pdf?src-supplier=Element14; ComponentLink7Description: https://datasheet.ciiva.com/7849/1018594-7849871.pdf?src-supplier=Element14
R129 R130 = Resistor: as R89 on sheet Zegar; Supplier 1: Digi-Key; Supplier Part Number 1: 311-0.0JRCT-ND; Stock 1: 69822252; Pricing 1: 1=0.10000, 10=0.01200, 25=0.00920, 50=0.00680, 100=0.00510, 250=0.00388, 500=0.00308, 1000=0.00227, 5000=0.00163 (USD); RoHS: Yes; Case/Package: 0402; Contact Plating: Tin,Matte; Case Code (Metric): 1005; Case Code (Imperial): 0402; Min Operating Temperature: -55°C; Max Operating Temperature: 155°C; Resistance: 0mR; Packaging: Tape and Reel; Composition: Thick Film; Package Quantity: 1; Number of Terminations: 2; Termination: SMD/SMT; Military Standard: Not; Features: Moisture Resistant; Length: 1mm; Height: 0.016inch; Width: 0.02inch; Depth: 0.5mm; Radiation Hardening: No; REACH SVHC: Unknown; Lead Free: Lead Free; ComponentLink1URL: https://datasheet.ciiva.com/2452/pyu-rc0402-51-rohs-l-6-2452608.pdf?src-supplier=Digi-Key; ComponentLink1Description: https://datasheet.ciiva.com/2452/pyu-rc0402-51-rohs-l-6-2452608.pdf?src-supplier=Digi-Key; ComponentLink2URL: https://datasheet.ciiva.com/11808/0900766b80c66297-11808195.pdf?src-supplier=RSComponents; ComponentLink2Description: https://datasheet.ciiva.com/11808/0900766b80c66297-11808195.pdf?src-supplier=RSComponents; ComponentLink3URL: https://datasheet.ciiva.com/2452/pyu-r-int-thick-7-2452609.pdf?src-supplier=Digi-Key; ComponentLink3Description: https://datasheet.ciiva.com/2452/pyu-r-int-thick-7-2452609.pdf?src-supplier=Digi-Key; ComponentLink4URL: https://datasheet.ciiva.com/22747/1018594-22747515.pdf?src-supplier=Element14; ComponentLink4Description: https://datasheet.ciiva.com/22747/1018594-22747515.pdf?src-supplier=Element14; ComponentLink5URL: https://datasheet.ciiva.com/7983/1018594-7983535.pdf?src-supplier=Element14; ComponentLink5Description: https://datasheet.ciiva.com/7983/1018594-7983535.pdf?src-supplier=Element14; ComponentLink6URL: https://datasheet.ciiva.com/2452/pyu-r-int-thick-7-2452610.pdf?src-supplier=Digi-Key; ComponentLink6Description: https://datasheet.ciiva.com/2452/pyu-r-int-thick-7-2452610.pdf?src-supplier=Digi-Key; ComponentLink7URL: https://datasheet.ciiva.com/8896/pyu-rc0402-51-rohs-l-6-8896201.pdf?src-supplier=Avnet; ComponentLink7Description: https://datasheet.ciiva.com/8896/pyu-rc0402-51-rohs-l-6-8896201.pdf?src-supplier=Avnet; ComponentLink8URL: https://datasheet.ciiva.com/28386/pyu-rc0402-51-rohs-l-6-28386633.pdf?src-supplier=Avnet+Europe; ComponentLink8Description: https://datasheet.ciiva.com/28386/pyu-rc0402-51-rohs-l-6-28386633.pdf?src-supplier=Avnet+Europe; ComponentLink9URL: https://datasheet.ciiva.com/15189/getdatasheetpartid-326379-15189533.pdf?src-supplier=Verical; ComponentLink9Description: https://datasheet.ciiva.com/15189/getdatasheetpartid-326379-15189533.pdf?src-supplier=Verical
U3 = INA226AIDGSR: IC MONITOR PWR/CURR BIDIR 10MSOP; Manufacturer: Texas Instruments; Min Supply Voltage: 2.7V; Max Supply Voltage: 5.5V; Nominal Supply Current: 330uA; Common Mode Rejection Ratio: 140dB; Output Current: 10mA; Input Bias Current: 10uA; Input Offset Voltage (Vos): 2.5uV; Accuracy: 0.02%; Supplier 1: Digi-Key; Manufacturer Part Number: INA226AIDGSR; Stock 1: 62024; Pricing 1: 1 = 2,88000, 10 = 2,58900, 100 = 2,12100, 500 = 1,80554, 1000 = 1,52275 (USD); RoHS: Yes; Mount: Surface Mount; Case/Package: VSSOP; Number of Pins: 10; Contact Plating: Gold; Min Operating Temperature: -40°C; Max Operating Temperature: 125°C; Packaging: Tape and Reel; Package Quantity: 1; Radiation Hardening: No; REACH SVHC: No SVHC; Lead Free: Lead Free; ComponentLink1URL: https://datasheet.ciiva.com/1939/ina226-1939633.pdf?src-supplier=Digi-Key; ComponentLink1Description: https://datasheet.ciiva.com/1939/ina226-1939633.pdf?src-supplier=Digi-Key; ComponentLink2URL: https://datasheet.ciiva.com/4875/sbos547-126280-4875559.pdf?src-supplier=Mouser; ComponentLink2Description: https://datasheet.ciiva.com/4875/sbos547-126280-4875559.pdf?src-supplier=Mouser; ComponentLink3URL: https://datasheet.ciiva.com/1939/ina226-1939634.pdf?src-supplier=Digi-Key; ComponentLink3Description: https://datasheet.ciiva.com/1939/ina226-1939634.pdf?src-supplier=Digi-Key; ComponentLink4URL: https://datasheet.ciiva.com/1939/ina226-1939635.pdf?src-supplier=Digi-Key; ComponentLink4Description: https://datasheet.ciiva.com/1939/ina226-1939635.pdf?src-supplier=Digi-Key; ComponentLink5URL: https://datasheet.ciiva.com/14196/ina226-14196741.pdf?src-supplier=Avnet; ComponentLink5Description: https://datasheet.ciiva.com/14196/ina226-14196741.pdf?src-supplier=Avnet; ComponentLink6URL: https://datasheet.ciiva.com/22693/1840205-22693516.pdf?src-supplier=Element14; ComponentLink6Description: https://datasheet.ciiva.com/22693/1840205-22693516.pdf?src-supplier=Element14

## Sheet Zasilanie_LMK.SchDoc
size A3
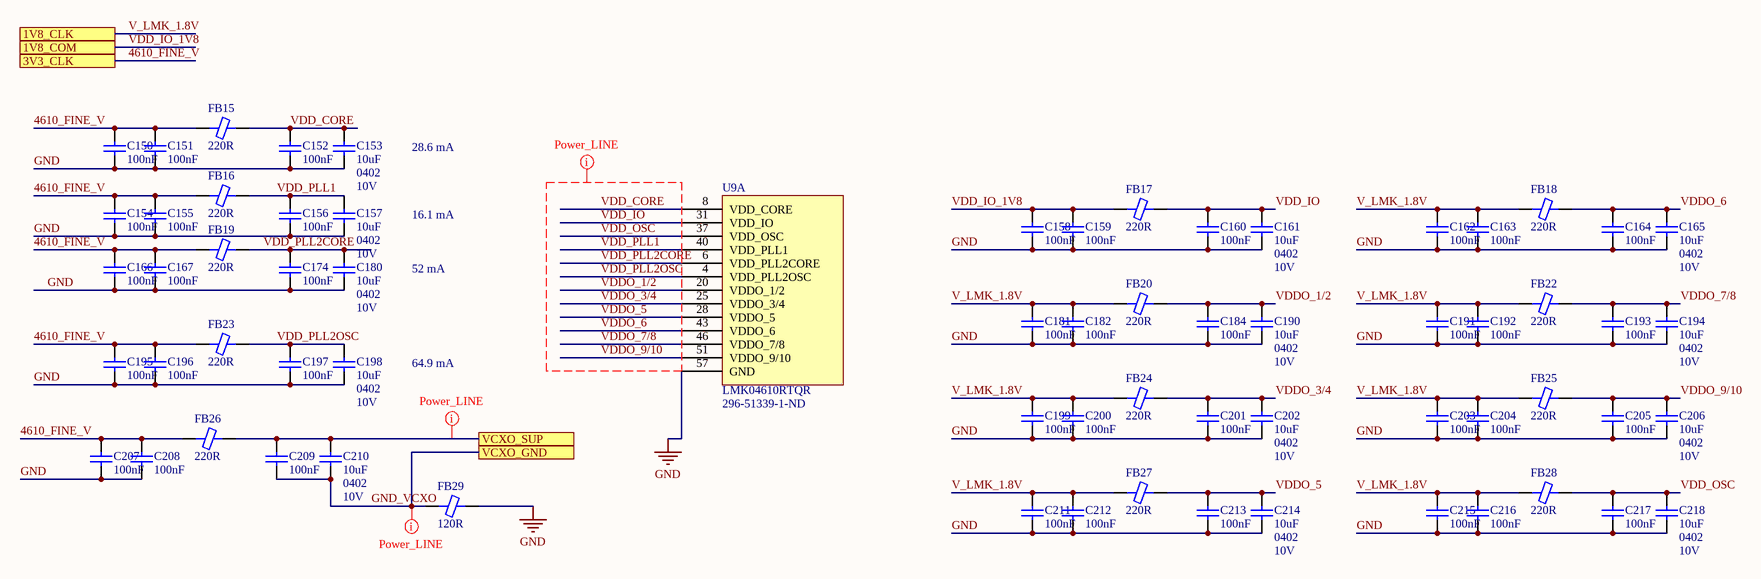
[diagram p13: Zasilanie_LMK.SchDoc]

### Parts
C150  100nF  [CAP 0201/0603 KK]
C151  100nF  [CAP 0201/0603 KK]
C152  100nF  [CAP 0201/0603 KK]
C153  10uF  Case/Package: 0402  Voltage Rating: 10V  [CAP 0402/1005 RF KK]
C154  100nF  [CAP 0201/0603 KK]
C155  100nF  [CAP 0201/0603 KK]
C156  100nF  [CAP 0201/0603 KK]
C157  10uF  Case/Package: 0402  Voltage Rating: 10V  [CAP 0402/1005 RF KK]
C158  100nF  [CAP 0201/0603 KK]
C159  100nF  [CAP 0201/0603 KK]
C160  100nF  [CAP 0201/0603 KK]
C161  10uF  Case/Package: 0402  Voltage Rating: 10V  [CAP 0402/1005 RF KK]
C162  100nF  [CAP 0201/0603 KK]
C163  100nF  [CAP 0201/0603 KK]
C164  100nF  [CAP 0201/0603 KK]
C165  10uF  Case/Package: 0402  Voltage Rating: 10V  [CAP 0402/1005 RF KK]
C166  100nF  [CAP 0201/0603 KK]
C167  100nF  [CAP 0201/0603 KK]
C174  100nF  [CAP 0201/0603 KK]
C180  10uF  Case/Package: 0402  Voltage Rating: 10V  [CAP 0402/1005 RF KK]
C181  100nF  [CAP 0201/0603 KK]
C182  100nF  [CAP 0201/0603 KK]
C184  100nF  [CAP 0201/0603 KK]
C190  10uF  Case/Package: 0402  Voltage Rating: 10V  [CAP 0402/1005 RF KK]
C191  100nF  [CAP 0201/0603 KK]
C192  100nF  [CAP 0201/0603 KK]
C193  100nF  [CAP 0201/0603 KK]
C194  10uF  Case/Package: 0402  Voltage Rating: 10V  [CAP 0402/1005 RF KK]
C195  100nF  [CAP 0201/0603 KK]
C196  100nF  [CAP 0201/0603 KK]
C197  100nF  [CAP 0201/0603 KK]
C198  10uF  Case/Package: 0402  Voltage Rating: 10V  [CAP 0402/1005 RF KK]
C199  100nF  [CAP 0201/0603 KK]
C200  100nF  [CAP 0201/0603 KK]
C201  100nF  [CAP 0201/0603 KK]
C202  10uF  Case/Package: 0402  Voltage Rating: 10V  [CAP 0402/1005 RF KK]
C203  100nF  [CAP 0201/0603 KK]
C204  100nF  [CAP 0201/0603 KK]
C205  100nF  [CAP 0201/0603 KK]
C206  10uF  Case/Package: 0402  Voltage Rating: 10V  [CAP 0402/1005 RF KK]
C207  100nF  [CAP 0201/0603 KK]
C208  100nF  [CAP 0201/0603 KK]
C209  100nF  [CAP 0201/0603 KK]
C210  10uF  Case/Package: 0402  Voltage Rating: 10V  [CAP 0402/1005 RF KK]
C211  100nF  [CAP 0201/0603 KK]
C212  100nF  [CAP 0201/0603 KK]
C213  100nF  [CAP 0201/0603 KK]
C214  10uF  Case/Package: 0402  Voltage Rating: 10V  [CAP 0402/1005 RF KK]
C215  100nF  [CAP 0201/0603 KK]
C216  100nF  [CAP 0201/0603 KK]
C217  100nF  [CAP 0201/0603 KK]
C218  10uF  Case/Package: 0402  Voltage Rating: 10V  [CAP 0402/1005 RF KK]
FB15  220R  [FER 0603/1608 KK]
FB16  220R  [FER 0603/1608 KK]
FB17  220R  [FER 0603/1608 KK]
FB18  220R  [FER 0603/1608 KK]
FB19  220R  [FER 0603/1608 KK]
FB20  220R  [FER 0603/1608 KK]
FB22  220R  [FER 0603/1608 KK]
FB23  220R  [FER 0603/1608 KK]
FB24  220R  [FER 0603/1608 KK]
FB25  220R  [FER 0603/1608 KK]
FB26  220R  [FER 0603/1608 KK]
FB27  220R  [FER 0603/1608 KK]
FB28  220R  [FER 0603/1608 KK]
FB29  120R  [FER 0603/1608 KK]
U9  LMK04610RTQR  Supplier Part Number 1: 296-51339-1-ND  [LMK04610]  (part A of 4)

### Ports
1V8_CLK, 1V8_COM, 3V3_CLK, VCXO_GND, VCXO_SUP

### Nets
GND: C150.1 C151.1 C152.1 C153.1 C154.1 C155.1 C156.1 C157.1 C158.1 C159.1 C160.1 C161.1 C162.1 C163.1 C164.1 C165.1 C166.1 C167.1 C174.1 C180.1 C181.1 C182.1 C184.1 C190.1 C191.1 C192.1 C193.1 C194.1 C195.1 C196.1 C197.1 C198.1 C199.1 C200.1 C201.1 C202.1 C203.1 C204.1 C205.1 C206.1 C207.1 C208.1 C211.1 C212.1 C213.1 C214.1 C215.1 C216.1 C217.1 C218.1 FB29.2 U9.57(GND)
4610_FINE_V: C150.2 C151.2 C154.2 C155.2 C166.2 C167.2 C195.2 C196.2 C207.2 C208.2 FB15.1 FB16.1 FB19.1 FB23.1 FB26.1 ; port 3V3_CLK  [project net 3V3@1A_1]
GND_VCXO: C209.1 C210.1 FB29.1 ; port VCXO_GND
V_LMK_1.8V: C162.2 C163.2 C181.2 C182.2 C191.2 C192.2 C199.2 C200.2 C203.2 C204.2 C211.2 C212.2 C215.2 C216.2 FB18.1 FB20.1 FB22.1 FB24.1 FB25.1 FB27.1 FB28.1 ; port 1V8_CLK  [project net 1V8@1A]
VC_SUPP: C209.2 C210.2 FB26.2 ; port VCXO_SUP
VDD_CORE: C152.2 C153.2 FB15.2 U9.8(VDD_CORE)
VDD_IO: C160.2 C161.2 FB17.2 U9.31(VDD_IO)
VDD_IO_1V8: C158.2 C159.2 FB17.1 ; port 1V8_COM  [project net 1V8@0A5_COM]
VDD_OSC: C217.2 C218.2 FB28.2 U9.37(VDD_OSC)
VDD_PLL1: C156.2 C157.2 FB16.2 U9.40(VDD_PLL1)
VDD_PLL2CORE: C174.2 C180.2 FB19.2 U9.6(VDD_PLL2CORE)
VDD_PLL2OSC: C197.2 C198.2 FB23.2 U9.4(VDD_PLL2OSC)
VDDO_1/2: C184.2 C190.2 FB20.2 U9.20(VDDO_1/2)
VDDO_3/4: C201.2 C202.2 FB24.2 U9.25(VDDO_3/4)
VDDO_5: C213.2 C214.2 FB27.2 U9.28(VDDO_5)
VDDO_6: C164.2 C165.2 FB18.2 U9.43(VDDO_6)
VDDO_7/8: C193.2 C194.2 FB22.2 U9.46(VDDO_7/8)
VDDO_9/10: C205.2 C206.2 FB25.2 U9.51(VDDO_9/10)

### Layout directives
net class Power_LINE: GND_VCXO, VC_SUPP, VDD_CORE, VDD_IO, VDD_OSC, VDD_PLL1, VDD_PLL2CORE, VDD_PLL2OSC, VDDO_1/2, VDDO_3/4, VDDO_5, VDDO_6, VDDO_7/8, VDDO_9/10

### Notes on the sheet
- 28.6 mA
- 16.1 mA
- 52 mA
- 64.9 mA
- Title
- Size:
- Date:
- A3
- Number:
- Time:
- Revision:
- Sheet
- of
- File:

### Library data of the parts
C150-C152 C154-C156 C158-C160 C162-C164 C166 C167 C174 C181 C182 C184 C191-C193 C195-C197 C199-C201 C203-C205 C207-C209 C211-C213 C215-C217 = Capacitor: Manufacturer 1: Murata; Manufacturer Part Number 1: GRM033R61C104ME84D; Voltage Rating: 16V; Tolerance: 20%; Dielectric: X5R; Supplier 1: Digi-Key; Supplier Part Number 1: 490-9986-1-ND; Stock 1: 503570; Pricing 1: 1=0.10000, 10=0.05400, 100=0.02430, 500=0.01732, 1000=0.01361, 2500=0.01238, 5000=0.01139 (USD); RoHS: Yes; Mount: Surface Mount; Case/Package: 0201; Weight: 1.2E-05oz; Case Code (Metric): 0603; Case Code (Imperial): 0201; Min Operating Temperature: -55°C; Max Operating Temperature: 85°C; Capacitance: 100nF; Packaging: Tape and Reel; Termination: SMD/SMT; Voltage Rating (DC): 16V; Package Quantity: 15000; Length: 0.024inch; Height: 0.3mm; Width: 0.3mm; Thickness: 0.013inch; ComponentLink1URL: http://www.mouser.com/ds/2/281/c02e-2905.pdf?src-supplier=Mouser; ComponentLink1Description: http://www.mouser.com/ds/2/281/c02e-2905.pdf?src-supplier=Mouser; ComponentLink2URL: http://search.murata.co.jp/Ceramy/image/img/A01X/G101/ENG/GRM033R61C104ME84-01.pdf?src-supplier=Digi-Key; ComponentLink2Description: http://search.murata.co.jp/Ceramy/image/img/A01X/G101/ENG/GRM033R61C104ME84-01.pdf?src-supplier=Digi-Key
C153 C157 C161 C165 C180 C190 C194 C198 C202 C206 C210 C214 C218 = Capacitor: as C171-C173 on sheet Zegar; Supplier 1: Digi-Key; Supplier Part Number 1: 1276-6830-1-ND; RoHS: Yes; Category: Ceramic Capacitors; Stock 1: 1457006; Pricing 1: 1=0,40000, 10=0,27900, 50=0,19500, 100=0,16710, 500=0,12534, 1000=0,10584, 2500=0,10027 (USD); Mount: Surface Mount; Case Code (Metric): 1005; Case Code (Imperial): 0402; Min Operating Temperature: -55°C; Max Operating Temperature: 85°C; Packaging: Tape and Reel; Capacitance: 10uF; Length: 0.039inch; Width: 0.02inch; Thickness: 0.035inch; ComponentLink1URL: http://www.samsungsem.com/kr/support/product-search/mlcc/CL05A106MP8NUB8.jsp?src-supplier=Digi-Key; ComponentLink1Description: http://www.samsungsem.com/kr/support/product-search/mlcc/CL05A106MP8NUB8.jsp?src-supplier=Digi-Key
FB15-FB20 FB22-FB28 = Ferrite: Manufacturer 1: Samsung; Manufacturer Part Number 1: CIS10P221NC; Current Rating: 2.5A; Tolerance: 25%; Number of Lines: 1; DC Resistance (DCR): 50mR; Supplier 1: Digi-Key; Supplier Part Number 1: 1276-6350-2-ND; Stock 1: 336000; Pricing 1: 4000=0.00880, 8000=0.00660, 12000=0.00638, 28000=0.00616, 100000=0.00572 (USD); RoHS: Yes; Mount: Surface Mount; Case/Package: 0603; Core Material: Ferrite; Case Code (Metric): 1608; Case Code (Imperial): 0603; Min Operating Temperature: -55°C; Max Operating Temperature: 125°C; Package Quantity: 1; Packaging: Cut Tape; Impedance: 220R; Max Current Rating: 2.5A; Max DC Current: 2.5A; Length: 0.063inch; Height: 0.037inch; Width: 0.031inch; Depth: 0.8mm; Radiation Hardening: No; Lead Free: Lead Free; ComponentLink1URL: https://datasheet.ciiva.com/29994/cis10p101ac-29994155.pdf?src-supplier=Avnet; ComponentLink1Description: https://datasheet.ciiva.com/29994/cis10p101ac-29994155.pdf?src-supplier=Avnet; ComponentLink2URL: https://datasheet.ciiva.com/16395/cic21-series-16395893.pdf?src-supplier=Future+Electronics; ComponentLink2Description: https://datasheet.ciiva.com/16395/cic21-series-16395893.pdf?src-supplier=Future+Electronics
FB29 = Ferrite: Manufacturer 1: TDK; Manufacturer Part Number 1: MPZ1608S121ATAH0; Current Rating: 2A; Tolerance: 25%; DC Resistance (DCR): 45mR; Supplier 1: Digi-Key; Supplier Part Number 1: 445-5219-1-ND; Stock 1: 68096; Pricing 1: 1=0.10000, 10=0.07900, 25=0.07160, 50=0.06440, 100=0.04720, 250=0.03432, 500=0.03146, 1000=0.02717 (USD); RoHS: Yes; Mount: Surface Mount; Case/Package: 0603; Core Material: Ferrite; Case Code (Metric): 1608; Case Code (Imperial): 0603; Package Quantity: 4000; Packaging: Tape and Reel; Impedance: 120R; Max DC Current: 2A; Length: 0.063inch; Height: 0.03inch; Width: 0.031inch; Depth: 0.8mm; ComponentLink1URL: https://datasheet.ciiva.com/46634/beads-commercial-power-mpz-en-46634726.pdf?src-supplier=Digi-Key; ComponentLink1Description: https://datasheet.ciiva.com/46634/beads-commercial-power-mpz-en-46634726.pdf?src-supplier=Digi-Key; ComponentLink2URL: https://datasheet.ciiva.com/46634/beads-commercial-power-mpz-en-46634728.pdf?src-supplier=Digi-Key; ComponentLink2Description: https://datasheet.ciiva.com/46634/beads-commercial-power-mpz-en-46634728.pdf?src-supplier=Digi-Key; ComponentLink3URL: https://datasheet.ciiva.com/48682/beads-commercial-power-mpz-en-48682494.pdf?src-supplier=Avnet; ComponentLink3Description: https://datasheet.ciiva.com/48682/beads-commercial-power-mpz-en-48682494.pdf?src-supplier=Avnet
U9 = LMK04610RTQR: as U9 on sheet Zegar; Supplier 1: Digi-Key; Manufacturer Part Number: LMK04610RTQR; Stock 1: 2022; Pricing 1: 1 = 20,47000, 10 = 18,87700, 100 = 16,11940, 500 = 14,63474 (USD); RoHS: No; Min Operating Temperature: -40°C; Max Operating Temperature: 85°C